# Altium project tracker-pro-airbnb-v1.1.PrjPcb (part 4 of 7)

## Sheet ESP32-Sheet.SchDoc
size 420 x 297 mm; SheetNumber: 7; SheetTotal: 10
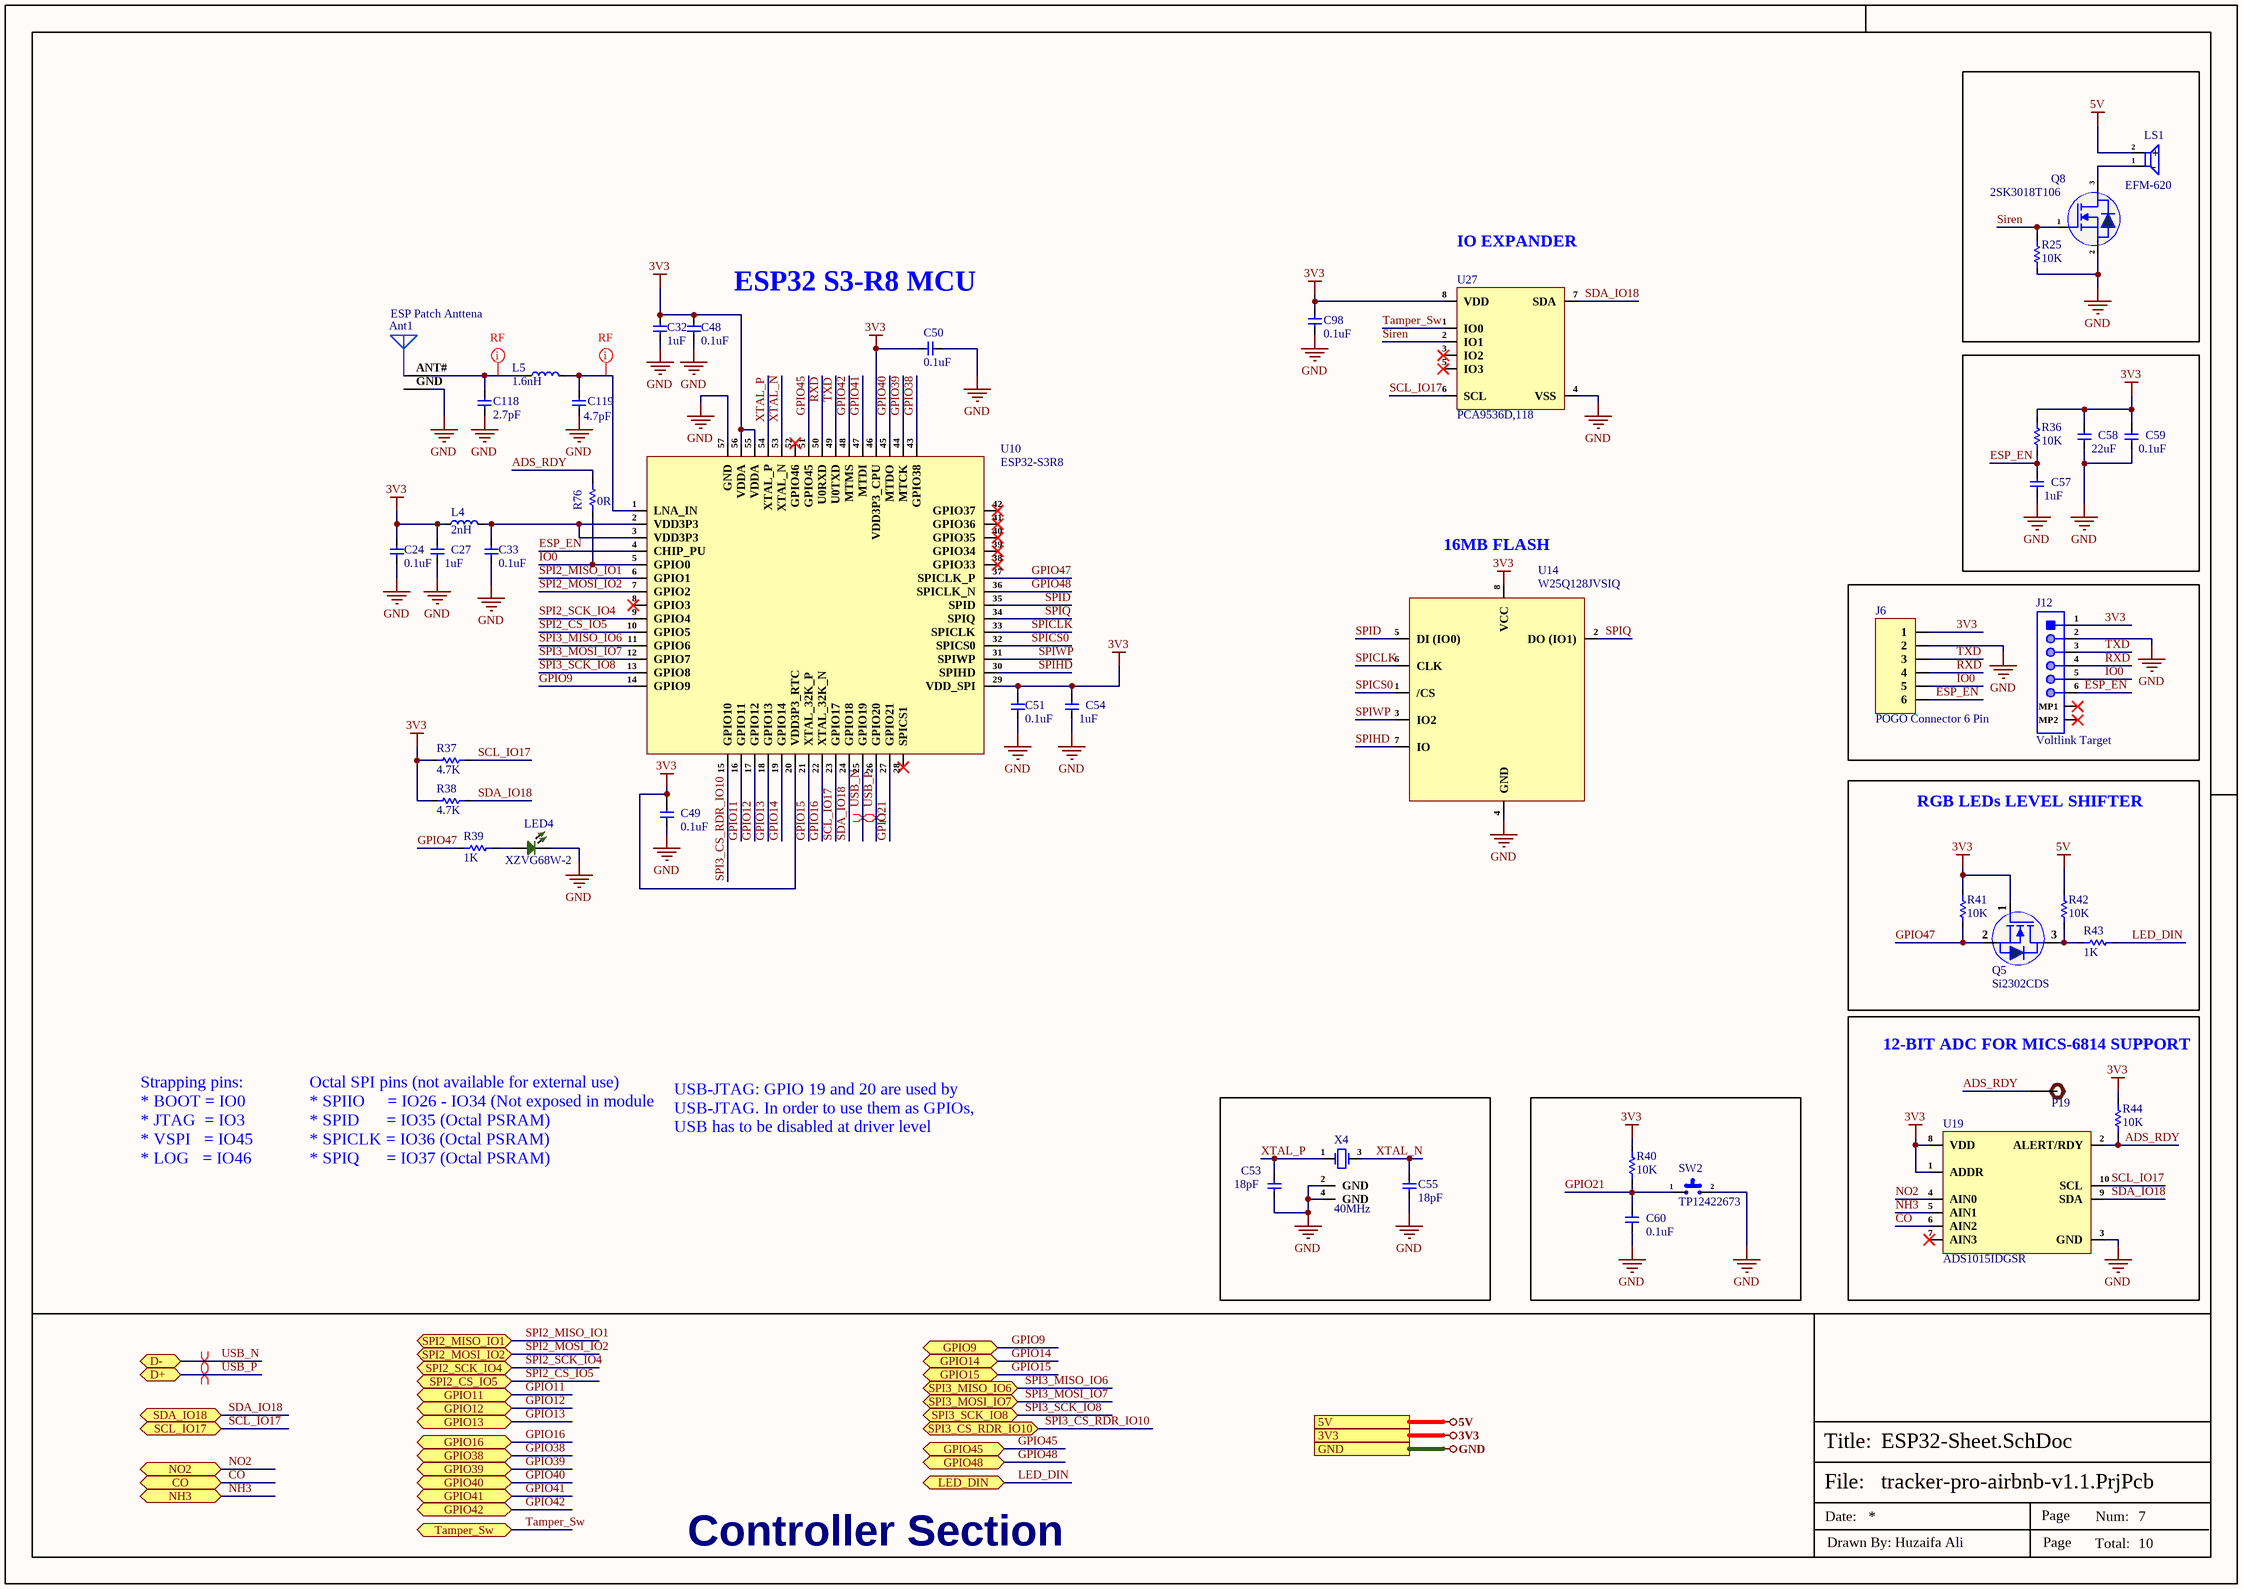
[diagram p5: ESP32-Sheet.SchDoc]

### Parts
Ant1  ESP Patch Anttena  [ESP Patch Antenna]  (net tie, no BOM)
C24  0.1uF  [Cap-0402]
C27  1uF  [Cap-0402]
C32  1uF  [Cap-0402]
C33  0.1uF  [Cap-0402]
C48  0.1uF  [Cap-0402]
C49  0.1uF  [Cap-0402]
C50  0.1uF  [Cap-0402]
C51  0.1uF  [Cap-0402]
C53  18pF  [Cap-0603]
C54  1uF  [Cap-0402]
C55  18pF  [Cap-0603]
C57  1uF  [Cap-0402]
C58  22uF  [Cap-0603]
C59  0.1uF  [Cap-0402]
C60  0.1uF  [Cap-0402]
C98  0.1uF  [Cap-0402]
C118  2.7pF  [CAP-0201]
C119  4.7pF  [CAP-0201]
J6  POGO Connector 6 Pin  [POGO 6 Pin]
J12  Voltlink Target  [Voltlink Target]
L4  2nH  [IND-0201]
L5  1.6nH  [IND-0201]
LED4  XZVG68W-2  [LED-0402]
LS1  EFM-620  [EFM-620]
P19  TEST POINT  [Test-point]  (value not drawn)
Q5  Si2302CDS  [Sot-23]
Q8  2SK3018T106  [SOT_323]
R25  10K  [Res-0402]
R36  10K  [Res-0402]
R37  4.7K  [Res-0603]
R38  4.7K  [Res-0603]
R39  1K  [Res-0603]
R40  10K  [Res-0603]
R41  10K  [Res-0402]
R42  10K  [Res-0402]
R43  1K  [Res-0603]
R44  10K  [Res-0402]
R76  0R  [Res-0603]
SW2  TP12422673  [TP12422673]
U10  ESP32-S3R8  [56-QFN (7x7)]
U14  W25Q128JVSIQ  [SOIC-8 (208 mil)]
U19  ADS1015IDGSR  [VSSOP-10]
U27  PCA9536D,118  [SOP-8]
X4  40MHz  [X322540MPB4SI_]

### Blocks framed on the sheet
RGB LEDs LEVEL SHIFTER: Q5 R41-R43
12-BIT ADC FOR MICS-6814 SUPPORT: P19 R44 U19

### Ports
3V3, 5V, CO (bidir), D+ (bidir), D- (bidir), GND, GPIO9 (bidir), GPIO11 (bidir), GPIO12 (bidir), GPIO13 (bidir), GPIO14 (bidir), GPIO15 (bidir), GPIO16 (bidir), GPIO38 (bidir), GPIO39 (bidir), GPIO40 (bidir), GPIO41 (bidir), GPIO42 (bidir), GPIO45 (bidir), GPIO48 (bidir), LED_DIN (bidir), NH3 (bidir), NO2 (bidir), SCL_IO17 (bidir), SDA_IO18 (bidir), SPI2_CS_IO5 (bidir), SPI2_MISO_IO1 (bidir), SPI2_MOSI_IO2 (bidir), SPI2_SCK_IO4 (bidir), SPI3_CS_RDR_IO10 (bidir), SPI3_MISO_IO6 (bidir), SPI3_MOSI_IO7 (bidir), SPI3_SCK_IO8 (bidir), Tamper_Sw (bidir)

### Nets
3V3: C24.2 C27.2 C32.2 C48.2 C49.2 C50.2 C51.2 C54.2 C58.2 C59.2 C98.1 J6.1 J12.1 L4.1 Q5.1(G) R36.2 R37.2 R38.2 R40.2 R41.1 R44.2 U10.20(VDD3P3_RTC) U10.29(VDD_SPI) U10.46(VDD3P3_CPU) U10.55(VDDA) U10.56(VDDA) U14.8(VCC) U19.1(ADDR) U19.8(VDD) U27.8(VDD) ; port 3V3
5V: LS1.2(+) R42.1 ; port 5V
GND: Ant1.GND C24.1 C27.1 C32.1 C33.1 C48.1 C49.1 C50.1 C51.1 C53.1 C54.1 C55.1 C57.1 C58.1 C59.1 C60.1 C98.2 C118.1 C119.1 J6.2 J12.2 LED4.2 Q8.2(S) R25.1 SW2.2 U10.57(GND) U14.4(GND) U19.3(GND) U27.4(VSS) X4.2(GND) X4.4(GND) ; port GND
ADS_RDY: P19.1 R44.1 R76.2 U19.2(ALERT/RDY)
CO: U19.6(AIN2) ; port CO
ESP_EN: C57.2 J6.6 J12.6 R36.1 U10.4(CHIP_PU)
GPIO9: U10.14(GPIO9) ; port GPIO9
GPIO11: U10.16(GPIO11) ; port GPIO11  [project net W5500_RST]
GPIO12: U10.17(GPIO12) ; port GPIO12
GPIO13: U10.18(GPIO13) ; port GPIO13
GPIO14: U10.19(GPIO14) ; port GPIO14  [project net B5]
GPIO15: U10.21(XTAL_32K_P) ; port GPIO15  [project net B6]
GPIO16: U10.22(XTAL_32K_N) ; port GPIO16
GPIO21: C60.2 R40.1 SW2.1 U10.27(GPIO21)
GPIO38: U10.43(GPIO38) ; port GPIO38
GPIO39: U10.44(MTCK) ; port GPIO39
GPIO40: U10.45(MTDO) ; port GPIO40
GPIO41: U10.47(MTDI) ; port GPIO41
GPIO42: U10.48(MTMS) ; port GPIO42
GPIO45: U10.51(GPIO45) ; port GPIO45  [project net CH2O_TX]
GPIO47: Q5.2(S) R39.1 R41.2 U10.37(SPICLK_P)
GPIO48: U10.36(SPICLK_N) ; port GPIO48  [project net CH2O_RX]
IO0: J6.5 J12.5 R76.1 U10.5(GPIO0)
LED_DIN: R43.2 ; port LED_DIN
NH3: U19.5(AIN1) ; port NH3
NO2: U19.4(AIN0) ; port NO2
RXD: J6.4 J12.4 U10.50(U0RXD)
SCL_IO17: R37.1 U10.23(GPIO17) U19.10(SCL) U27.6(SCL) ; port SCL_IO17  [project net SCL]
SDA_IO18: R38.1 U10.24(GPIO18) U19.9(SDA) U27.7(SDA) ; port SDA_IO18  [project net SDA]
Siren: Q8.1(G) R25.2 U27.2(IO1)
SPI2_CS_IO5: U10.10(GPIO5) ; port SPI2_CS_IO5
SPI2_MISO_IO1: U10.6(GPIO1) ; port SPI2_MISO_IO1
SPI2_MOSI_IO2: U10.7(GPIO2) ; port SPI2_MOSI_IO2
SPI2_SCK_IO4: U10.9(GPIO4) ; port SPI2_SCK_IO4
SPI3_CS_RDR_IO10: U10.15(GPIO10) ; port SPI3_CS_RDR_IO10  [project net B1]
SPI3_MISO_IO6: U10.11(GPIO6) ; port SPI3_MISO_IO6  [project net B4]
SPI3_MOSI_IO7: U10.12(GPIO7) ; port SPI3_MOSI_IO7  [project net B3]
SPI3_SCK_IO8: U10.13(GPIO8) ; port SPI3_SCK_IO8  [project net B2]
SPICLK: U10.33(SPICLK) U14.6(CLK)
SPICS0: U10.32(SPICS0) U14.1(/CS)
SPID: U10.35(SPID) U14.5(DI_(IO0))
SPIHD: U10.30(SPIHD) U14.7(IO)
SPIQ: U10.34(SPIQ) U14.2(DO_(IO1))
SPIWP: U10.31(SPIWP) U14.3(IO2)
Tamper_Sw: U27.1(IO0) ; port Tamper_Sw
TXD: J6.3 J12.3 U10.49(U0TXD)
USB_N: U10.25(GPIO19) ; port D-
USB_P: U10.26(GPIO20) ; port D+
XTAL_N: C55.2 U10.53(XTAL_N) X4.3(CRYSTAL)
XTAL_P: C53.2 U10.54(XTAL_P) X4.1(CRYSTAL)
NetAnt1_ANT#: Ant1.ANT# C118.2 L5.1
NetC33_2: C33.2 L4.2 U10.2(VDD3P3) U10.3(VDD3P3)
NetC119_2: C119.2 L5.2 U10.1(LNA_IN)
NetLED4_1: LED4.1 R39.2
NetLS1_1: LS1.1(-) Q8.3(D)
NetQ5_3: Q5.3(D) R42.2 R43.1

Not connected (* = marked no-connect by the designer): J12 MP1* MP2*; U10 8(GPIO3)* 28(SPICS1)* 38(GPIO33)* 39(GPIO34)* 40(GPIO35)* 41(GPIO36)* 42(GPIO37)* 52(GPIO46)*; U19 7(AIN3)*; U27 3(IO2)* 5(IO3)*

### Layout directives
differential pair; net class USB; differential pair class USB_Lines; rule Impedance Constraint [Min = 87.00    Max = 92.00    ]; rule Matched Net Lengths [Tolerance = 0.508mm]: USB_N, USB_P
net class RF: NetAnt1_ANT#, NetC119_2

### Notes on the sheet
- (near U27) IO EXPANDER
- ESP32 S3-R8 MCU
- (near U14) 16MB FLASH
- Strapping pins:
  * BOOT = IO0
  * JTAG  = IO3
  * VSPI   = IO45
  * LOG   = IO46
- Octal SPI pins (not available for external use)
  * SPIIO     = IO26 - IO34 (Not exposed in module
  * SPID      = IO35 (Octal PSRAM)
  * SPICLK = IO36 (Octal PSRAM)
  * SPIQ      = IO37 (Octal PSRAM)
- USB-JTAG: GPIO 19 and 20 are used by USB-JTAG. In order to use them as GPIOs, USB has to be disabled at driver level
- Controller Section
- File:
- Title:
- Date:
- Page
- Num:
- Total:
- Drawn By: Huzaifa Ali

### Library data of the parts
Ant1 = ESP Patch Anttena: ESP32 MIFA PCB ANTENNA; Item Type: Antenna; Manufacturer Part Number: ESP Patch Anttena
C24 C33 C48-C51 C59 C60 C98 = C1005X5R1H104K050BB: CAP CER 0.1UF 50V X5R 0402; Manufacturer: TDK; Dielectric Material: Ceramic; Capacitance: 100nF; Tolerance: 10%; Supplier 1: Digi-Key; Manufacturer Part Number: C1005X5R1H104K050BB; Stock 1: 1455182; Pricing 1: 1=0.12, 10=0.09, 50=0.049, 100=0.04, 500=0.02858, 1000=0.02245, 2500=0.02041, 5000=0.01878 (USD); Mount: Surface Mount; Case/Package: 0402; Case Code (Metric): 1005; Case Code (Imperial): 0402; Weight: 2.3E-05oz; Min Operating Temperature: -55°C; Max Operating Temperature: 85°C; Dielectric: X5R; Voltage Rating: 50V; Packaging: Tape and Reel; Voltage Rating (DC): 50V; Termination: SMD/SMT; Construction: Flat; Package Quantity: 1; Resistor Type: Ceramic; Voltage: 50V; Series: C; Length: 1mm; Width: 0.02inch; Height: 0.5mm; Depth: 0.5mm; Thickness: 0.022inch; Radiation Hardening: No; Lead Free: Lead Free; REACH SVHC: No SVHC; RoHS Compliant: Yes; ComponentLink1URL: https://product.tdk.com/info/en/catalog/spec/mlccspec_commercial_general_midvoltage_en.pdf?src-supplier=Digi-Key; ComponentLink1Description: https://product.tdk.com/info/en/catalog/spec/mlccspec_commercial_general_midvoltage_en.pdf?src-supplier=Digi-Key; ComponentLink2URL: http://www.tdk.co.jp/tefe02/e413_c.pdf?src-supplier=Future+Electronics; ComponentLink2Description: http://www.tdk.co.jp/tefe02/e413_c.pdf?src-supplier=Future+Electronics; ComponentLink3URL: https://www.verical.com/server-webapp/html/getDatasheet?partID=743571&src-supplier=Verical; ComponentLink3Description: https://www.verical.com/server-webapp/html/getDatasheet?partID=743571&src-supplier=Verical; ComponentLink4URL: http://www.tdk.co.jp/tefe02/e412_c.pdf?src-supplier=Avnet+Europe; ComponentLink4Description: http://www.tdk.co.jp/tefe02/e412_c.pdf?src-supplier=Avnet+Europe; Supplier Part Number 1: 445-5942-1-ND; LCSC Part Number: C2181865
C27 C32 C54 C57 = CC0402KRX5R6BB105: CAP CER 1UF 10V X5R 0402; Manufacturer: Yageo; Tolerance: 10%; Dissipation Factor: 15%; Supplier 1: Mouser; Manufacturer Part Number: CC0402KRX5R6BB105; RoHS: Yes; Category: Ceramic Capacitors; Stock 1: 6711367; Pricing 1: 1=0.11000, 10=0.05500, 50=0.05500, 100=0.03300, 500=0.02700, 1000=0.02200, 2500=0.02100, 10000=0.01800 (USD); Mount: Surface Mount; Case/Package: 0402; Number of Pins: 2; Case Code (Metric): 1005; Case Code (Imperial): 0402; Min Operating Temperature: -55°C; Max Operating Temperature: 85°C; Capacitance: 1uF; Dielectric: X5R; Package Quantity: 1; Voltage Rating: 10V; Packaging: Tape and Reel; Voltage Rating (DC): 10V; Termination: SMD/SMT; Resistor Type: Ceramic; Series: CC; Construction: Flat; Length: 1mm; Width: 0.02inch; Height: 0.5mm; Thickness: 0.022inch; Depth: 0.5mm; Radiation Hardening: No; REACH SVHC: No SVHC; Lead Free: Lead Free; Halogen Free: Halogen Free; RoHS Compliant: Yes; ComponentLink1URL: https://datasheet.ciiva.com/176/upy-gphc-x5r-4v-to-50v-12-176704.pdf?src-supplier=Digi-Key; ComponentLink1Description: https://datasheet.ciiva.com/176/upy-gphc-x5r-4v-to-50v-12-176704.pdf?src-supplier=Digi-Key; ComponentLink2URL: https://datasheet.ciiva.com/176/mlccorderingcode-176705.pdf?src-supplier=Digi-Key; ComponentLink2Description: https://datasheet.ciiva.com/176/mlccorderingcode-176705.pdf?src-supplier=Digi-Key; ComponentLink3URL: https://datasheet.ciiva.com/176/mlccorderingcode-176706.pdf?src-supplier=Digi-Key; ComponentLink3Description: https://datasheet.ciiva.com/176/mlccorderingcode-176706.pdf?src-supplier=Digi-Key; Supplier Part Number 1: 603-CC402KRX5R6BB105; LCSC Part Number: C106254
C53 C55 = CL10C180JB8NNNC: CAP CER 18PF 50V C0G/NP0 0603; Manufacturer: Samsung; Material: Ceramic; Tolerance: 5%; Dielectric: C0G; Temperature Coefficient: 300ppm/°C; Supplier 1: Arrow Electronics; Manufacturer Part Number: CL10C180JB8NNNC; RoHS: Yes; Category: Ceramic Capacitors; Stock 1: 1828000; Pricing 1: 4000=0.00360, 8000=0.00210 (USD); Mount: Surface Mount; Case/Package: 0603; Case Code (Metric): 1608; Case Code (Imperial): 0603; Contact Plating: Tin; Min Operating Temperature: -55°C; Max Operating Temperature: 125°C; Capacitance: 18pF; Voltage: 50V; Packaging: Tape and Reel; Voltage Rating: 50V; Series: CL; Construction: Flat; Length: 1.6mm; Width: 0.031inch; Height: 0.8mm; Depth: 0.8mm; Thickness: 0.035inch; Radiation Hardening: No; RoHS Compliant: Yes; ComponentLink1URL: https://datasheet.ciiva.com/25709/cl10c180jb8nnnc-25709670.pdf?src-supplier=Digi-Key; ComponentLink1Description: https://datasheet.ciiva.com/25709/cl10c180jb8nnnc-25709670.pdf?src-supplier=Digi-Key; ComponentLink2URL: https://datasheet.ciiva.com/26838/getdatasheetpartid-660083-26838496.pdf?src-supplier=Verical; ComponentLink2Description: https://datasheet.ciiva.com/26838/getdatasheetpartid-660083-26838496.pdf?src-supplier=Verical; ComponentLink3URL: https://datasheet.ciiva.com/29198/457219-da-01-en-vs-kondensator-0603-29198763.pdf?src-supplier=Conrad; ComponentLink3Description: https://datasheet.ciiva.com/29198/457219-da-01-en-vs-kondensator-0603-29198763.pdf?src-supplier=Conrad; ComponentLink4URL: https://datasheet.ciiva.com/26310/mlcc-catalogdownload2013-eng-26310310.pdf?src-supplier=Distrelec; ComponentLink4Description: https://datasheet.ciiva.com/26310/mlcc-catalogdownload2013-eng-26310310.pdf?src-supplier=Distrelec; Supplier Part Number 1: CL10C180JB8NNNC
C58 = CC0603MRX5R6BB226: CAP CER 22UF 10V X5R 0603; Manufacturer: Yageo; Tolerance: 20%; Item Type: Capacitor; Supplier 1: Digi-Key; Manufacturer Part Number: CC0603MRX5R6BB226; RoHS: Yes; Category: Ceramic Capacitors; Stock 1: 19628; Pricing 1: 1=0.68000, 10=0.48000, 50=0.36300, 100=0.31610, 500=0.23416, 1000=0.19903 (USD); Mount: Surface Mount; Case/Package: 0603; Case Code (Metric): 1608; Case Code (Imperial): 0603; Weight: 7.1E-05oz; Min Operating Temperature: -55°C; Max Operating Temperature: 85°C; Packaging: Tape and Reel; Capacitance: 22uF; Voltage Rating: 10V; Dielectric: X5R; Termination: SMD/SMT; Voltage Rating (DC): 10V; Package Quantity: 4000; Length: 0.063inch; Width: 0.8mm; Height: 0.8mm; Thickness: 0.035inch; Lead Free: Lead Free; Halogen Free: Halogen Free; RoHS Compliant: Yes; ComponentLink1URL: http://www.mouser.com/ds/2/447/Yageo_UPY-GP_NP0_16V-to-50V_9-358835.pdf?src-supplier=Mouser; ComponentLink1Description: http://www.mouser.com/ds/2/447/Yageo_UPY-GP_NP0_16V-to-50V_9-358835.pdf?src-supplier=Mouser; ComponentLink2URL: http://www.yageo.com/documents/recent/UPY-GPHC_X5R_4V-to-50V_25.pdf?src-supplier=Digi-Key; ComponentLink2Description: http://www.yageo.com/documents/recent/UPY-GPHC_X5R_4V-to-50V_25.pdf?src-supplier=Digi-Key; Supplier Part Number 1: 311-1819-1-ND; LCSC Part Number: C109447
C118 = CC0201CRNPO9BN2R7: CAP CER 2.7PF 50V C0G/NPO 0201; Manufacturer: Yageo; Dielectric: C0G; Item Type: Capacitor; Supplier: Avnet; Supplier Part Number: CC0201CRNPO9BN2R7; Manufacturer Part Number: CC0201CRNPO9BN2R7; RoHS: Yes; Category: Ceramic Capacitors; Stock: 15000; Pricing: 15000=0.0017 (USD); Mounting Technology: Surface Mount; Case/Package: 0201; Case Code (Imperial): 0201; Case Code (Metric): 0603; Weight: 6E-06oz; Min Operating Temperature: -55°C; Max Operating Temperature: 125°C; Value: 2.7pF; Packaging: Tape and Reel; Voltage Rating (DC): 50V; Voltage Rating: 50V; Termination: SMD/SMT; Series: CC; Length: 0.024inch; Width: 0.012inch; Thickness: 0.013inch; RoHS Compliant: Yes; ComponentLink1URL: https://datasheet.ciiva.com/13208/upy-gp-np0-16v-to-50v-8-13208314.pdf?src-supplier=Mouser; ComponentLink1Description: https://datasheet.ciiva.com/13208/upy-gp-np0-16v-to-50v-8-13208314.pdf?src-supplier=Mouser; LCSC Part Number: C325439
C119 = CC0201BRNPO9BN4R7: CAP CER 4.7PF 50V C0G/NPO 0201; Manufacturer: Yageo; Item Type: Capacitor; Supplier: Arrow Electronics; Supplier Part Number: CC0201BRNPO9BN4R7; Manufacturer Part Number: CC0201BRNPO9BN4R7; RoHS: Yes; Category: Ceramic Capacitors; Stock: 210000; Pricing: 15000=0.0023 (USD); Mounting Technology: Surface Mount; Case/Package: 0201; Min Operating Temperature: -55°C; Max Operating Temperature: 125°C; Packaging: Tape and Reel; Value: 4.7pF; Voltage Rating: 50V; Series: CC; Length: 0.024inch; Width: 0.012inch; Thickness: 0.013inch; RoHS Compliant: Yes; ComponentLink1URL: https://www.yageo.com/upload/media/product/productsearch/datasheet/mlcc/UPY-GP_NP0_16V-to-50V_18.pdf?src-supplier=Digi-Key; ComponentLink1Description: https://www.yageo.com/upload/media/product/productsearch/datasheet/mlcc/UPY-GP_NP0_16V-to-50V_18.pdf?src-supplier=Digi-Key; ComponentLink2URL: http://www.yageo.com/documents/recent/UPY-GP_NP0_16V-to-50V_16.pdf?src-supplier=Digi-Key; ComponentLink2Description: http://www.yageo.com/documents/recent/UPY-GP_NP0_16V-to-50V_16.pdf?src-supplier=Digi-Key; LCSC Part Number: C505471
J6 = POGO Connector 6 Pin: Pogo Pad 2.5mm 6 Pin
J12 = C145963: 1x6P SH 1 1mm 6 SMD,P=1mm Wire To Board / Wire To Wire Connector ROHS; Manufacturer: BOOMELE; Manufacturer Part Number: C145963; Package: SMD,P=1mm; LCSC Part Number: C145963; Item Type: Connector; ComponentLink1Description: LCSC; ComponentLink1URL: https://www.lcsc.com/product-detail/Wire-To-Board-Wire-To-Wire-Connector_BOOMELE-Boom-Precision-Elec-C145963_C145963.html
L4 = MLG0603P2N0CT000: FIXED IND 2NH 600MA 100 MOHM SMD; Manufacturer: TDK; Core Material: Non-Magnetic; Shielding: Unshielded; DC Resistance (DCR): 100mR; Self Resonant Frequency: 8.5GHz; Test Frequency: 500MHz; Item Type: Inductor; Supplier: Digi-Key; Supplier Part Number: 445-172431-1-ND; Manufacturer Part Number: MLG0603P2N0CT000; RoHS: Yes; Category: Fixed Inductors; Stock: 23499; Pricing: 1=0.13, 10=0.118, 25=0.1, 50=0.0882, 100=0.0808, 250=0.07352, 500=0.06908, 1000=0.05292, 2500=0.04998 (USD); Mounting Technology: Surface Mount; Case/Package: 0201; Case Code (Metric): 0603; Case Code (Imperial): 0201; Min Operating Temperature: -55°C; Max Operating Temperature: 125°C; Package Quantity: 15000; Packaging: Cut Tape; Current Rating: 600mA; Value: 2nH; Series: MLG-P; Length: 0.024inch; Width: 0.012inch; Height - Seated (Max): 0.013inch; RoHS Compliant: Yes; ComponentLink1URL: https://datasheet.ciiva.com/41860/inductor-commercial-high-frequency-mlg-qp-en-41860968.pdf?src-supplier=Digi-Key; ComponentLink1Description: https://datasheet.ciiva.com/41860/inductor-commercial-high-frequency-mlg-qp-en-41860968.pdf?src-supplier=Digi-Key; LCSC Part Number: C531323
L5 = LQP03HQ1N6B02D: FIXED IND 1.6NH 1A 50 MOHM SMD; Manufacturer: Murata; Core Material: Non-Magnetic; Shielding: Unshielded; DC Resistance (DCR): 50mR; Self Resonant Frequency: 10GHz; Test Frequency: 500MHz; Item Type: Inductor; Supplier: Digi-Key; Supplier Part Number: 490-13883-1-ND; Manufacturer Part Number: LQP03HQ1N6B02D; RoHS: Yes; Category: Fixed Inductors; Stock: 27606; Pricing: 1=0.16, 10=0.145, 25=0.1236, 50=0.109, 100=0.1, 250=0.09088, 500=0.08544, 1000=0.06545, 2500=0.06181 (USD); Mounting Technology: Surface Mount; Case/Package: 0201; Case Code (Imperial): 0201; Case Code (Metric): 0603; Min Operating Temperature: -55°C; Max Operating Temperature: 125°C; Packaging: Cut Tape; Value: 1.6nH; Current Rating: 1A; Series: LQP03; RoHS Compliant: Yes; ComponentLink1URL: http://search.murata.co.jp/Ceramy/image/img/P02/JELF243C-0021.pdf?src-supplier=Digi-Key; ComponentLink1Description: http://search.murata.co.jp/Ceramy/image/img/P02/JELF243C-0021.pdf?src-supplier=Digi-Key; LCSC Part Number: C237384
LED4 = XZVG68W-2: LED GREEN CLEAR CHIP SMD; Manufacturer: SunLED; Lens Color: Colorless; Luminous Intensity: 49mcd; Test Current: 20mA; Viewing Angle: 120°; Dominant Wavelength: 570nm; Forward Voltage: 2.1V; Supplier 1: Digi-Key; Manufacturer Part Number: XZVG68W-2; Stock 1: 4185; Pricing 1: 1=0.5, 10=0.36, 100=0.16, 500=0.112, 1000=0.092 (USD); Mount: Surface Mount; Case/Package: 0402; Color: Green; Case Code (Metric): 1005; Case Code (Imperial): 0402; Packaging: Tape and Reel; Lens Transparency: Clear; Length: 1mm; Height: 0.6mm; Width: 0.5mm; ComponentLink1URL: http://www.sunledusa.com/products/spec/XZVG68W-2.pdf?src-supplier=Digi-Key; ComponentLink1Description: http://www.sunledusa.com/products/spec/XZVG68W-2.pdf?src-supplier=Digi-Key; ComponentLink2URL: https://www.sunledusa.com/products/spec/XZVG68W-2.pdf?src-supplier=Digi-Key; ComponentLink2Description: https://www.sunledusa.com/products/spec/XZVG68W-2.pdf?src-supplier=Digi-Key; Supplier Part Number 1: 1497-1219-6-ND; Item Type: LED
LS1 = EFM-620: BUZZER 9V 40MM TH; Manufacturer: East Electronics; Pakage: Custom; Manufacturer Part Number: EFM-620; Item Type: Buzzer; ComponentLink1Description: Digikey; ComponentLink1URL: https://www.digikey.com/en/products/detail/east-electronics/EFM-620/13170549
P19 = TEST POINT: Test Point ON; Item Type: TEST POINT
Q5 = Si2302CDS: N-CHANNEL 20-V (D-S) MOSFET; Manufacturer: TECH PUBLIC; ComponentLink1Description: LCSC; ComponentLink1URL: https://www.lcsc.com/product-detail/MOSFETs_TECH-PUBLIC-SI2302CDS_C5310968.html; Manufacturer Part Number: SI2302CDS; Package: SOT-23; LCSC Part Number: C5310968; Item Type: Mosfet
Q8 = 2SK3018T106: MOSFET N-CH 30V .1A SOT-323; Manufacturer: Rohm; Rise Time: 35ns; Nominal Vgs: 1.5V; Rds On Max: 8R; Input Capacitance: 13pF; Continuous Drain Current (ID): 100mA; Power Dissipation: 200mW; Drain to Source Resistance: 7R; Turn-Off Delay Time: 80ns; Turn-On Delay Time: 15ns; Element Configuration: Single; Gate to Source Voltage (Vgs): 20V; On-State Resistance: 13R; Polarity: N-CHANNEL; Supplier 1: Digi-Key; Manufacturer Part Number: 2SK3018T106; RoHS: Yes; Category: MOSFETs; Stock 1: 35632; Pricing 1: 1=0.40000, 10=0.33100, 100=0.17560, 500=0.11550, 1000=0.07854 (USD); Mount: Surface Mount; Case/Package: SOT-323; Number of Pins: 3; Contact Plating: Copper,Tin,Silver; Min Operating Temperature: -55°C; Max Operating Temperature: 150°C; Package Quantity: 3000; Packaging: Tape and Reel; Dual Supply Voltage: 30V; Drain to Source Breakdown Voltage: 30V; Fall Time: 35ns; Drain to Source Voltage (Vdss): 30V; Max Power Dissipation: 200mW; Threshold Voltage: 1.5V; Termination: SMD/SMT; Voltage Rating (DC): 30V; Current Rating: 100mA; Drain-source On Resistance-Max: 13R; Series: -; Length: 2mm; Width: 1.25mm; Height: 0.8mm; Radiation Hardening: No; Reach SVHC Compliant: Yes; Lead Free: Lead Free; RoHS Compliant: Yes; ComponentLink1URL: https://datasheet.ciiva.com/16307/2sk3018-16307708.pdf?src-supplier=Future+Electronics; ComponentLink1Description: https://datasheet.ciiva.com/16307/2sk3018-16307708.pdf?src-supplier=Future+Electronics; ComponentLink2URL: https://datasheet.ciiva.com/13043/2sk3018-209190-13043441.pdf?src-supplier=Mouser; ComponentLink2Description: https://datasheet.ciiva.com/13043/2sk3018-209190-13043441.pdf?src-supplier=Mouser; ComponentLink3URL: https://datasheet.ciiva.com/1188/2sk3018-1188589.pdf?src-supplier=Element14; ComponentLink3Description: https://datasheet.ciiva.com/1188/2sk3018-1188589.pdf?src-supplier=Element14; ComponentLink4URL: https://datasheet.ciiva.com/934/2sk3018-934635.pdf?src-supplier=Digi-Key; ComponentLink4Description: https://datasheet.ciiva.com/934/2sk3018-934635.pdf?src-supplier=Digi-Key; ComponentLink5URL: https://datasheet.ciiva.com/934/2sk3018-934636.pdf?src-supplier=Digi-Key; ComponentLink5Description: https://datasheet.ciiva.com/934/2sk3018-934636.pdf?src-supplier=Digi-Key; LCSC Part Number: C113315; Item Type: Mosfet; Supplier Part Number 1: 2SK3018T106CT-ND
R25 R36 R41 R42 R44 = RC0402FR-0710KL: RES 10K OHM 1% 1/16W 0402; Manufacturer: Yageo; Resistance: 10kR; Voltage Rating (DC): 50V; Temperature Coefficient: 100ppm/°C; Power Rating: 62.5mW; Max Power Dissipation: 63mW; Item Type: Resistor; Supplier 1: Mouser; Manufacturer Part Number: RC0402FR-0710KL; RoHS: Yes; Category: Chip SMD Resistors; Stock 1: 18648329; Pricing 1: 1=0.10000, 10=0.01400, 50=0.01400, 100=0.00500, 1000=0.00300, 10000=0.00200 (USD); Case/Package: 0402; Number of Pins: 2; Case Code (Imperial): 0402; Case Code (Metric): 1005; Min Operating Temperature: -55°C; Max Operating Temperature: 155°C; Resistor Type: Thick Film; Tolerance: 1%; Packaging: Tape and Reel; Voltage Rating: 50V; Termination: SMD/SMT; Working Voltage: 50V; Number of Terminations: 2; Features: Moisture Resistant; Series: RC; Resistance Tolerance: 1%; Construction: Rectangular; Length: 1mm; Width: 0.5mm; Height: 0.32mm; Depth: 0.5mm; Lead Pitch: 0.2mm; REACH SVHC: No SVHC; Lead Free: Lead Free; RoHS Compliant: Yes; Military Standard: Not; ComponentLink1URL: https://datasheet.ciiva.com/7660/38568-7660787.pdf?src-supplier=Element14; ComponentLink1Description: https://datasheet.ciiva.com/7660/38568-7660787.pdf?src-supplier=Element14; ComponentLink2URL: https://datasheet.ciiva.com/7849/1686128-7849814.pdf?src-supplier=Element14; ComponentLink2Description: https://datasheet.ciiva.com/7849/1686128-7849814.pdf?src-supplier=Element14; ComponentLink3URL: https://datasheet.ciiva.com/7983/1018594-7983486.pdf?src-supplier=Element14; ComponentLink3Description: https://datasheet.ciiva.com/7983/1018594-7983486.pdf?src-supplier=Element14; ComponentLink4URL: https://datasheet.ciiva.com/22747/1018594-22747512.pdf?src-supplier=Element14; ComponentLink4Description: https://datasheet.ciiva.com/22747/1018594-22747512.pdf?src-supplier=Element14; ComponentLink5URL: https://datasheet.ciiva.com/12667/pyu-rc0402-51-rohs-l-6-r-12667067.pdf?src-supplier=Mouser; ComponentLink5Description: https://datasheet.ciiva.com/12667/pyu-rc0402-51-rohs-l-6-r-12667067.pdf?src-supplier=Mouser; ComponentLink6URL: https://datasheet.ciiva.com/7849/1784430-7849813.pdf?src-supplier=Element14; ComponentLink6Description: https://datasheet.ciiva.com/7849/1784430-7849813.pdf?src-supplier=Element14; ComponentLink7URL: https://datasheet.ciiva.com/7849/1784430-7849815.pdf?src-supplier=Element14; ComponentLink7Description: https://datasheet.ciiva.com/7849/1784430-7849815.pdf?src-supplier=Element14; Supplier Part Number 1: 603-RC0402FR-0710KL; LCSC Part Number: C60490
R37 R38 = RC0603FR-074K7L: RES SMD 4.7K OHM 1% 1/10W 0603; Manufacturer: Yageo; Item Type: Resistor; Manufacturer Part Number: RC0603FR-074K7L; Package: 0603; ComponentLink7Description: LCSC; ComponentLink7URL: https://www.lcsc.com/product-detail/Chip-Resistor-Surface-Mount_YAGEO-RC0603FR-074K7L_C99782.html; LCSC Part Number: C99782
R39 R43 = RC0603FR-071KL: RES SMD 1K OHM 1% 1/10W 0603; Manufacturer: Yageo; Resistance: 1kR; Temperature Coefficient: 100ppm/°C; Power Rating: 100mW; Voltage Rating: 50V; Item type: Resistor; ComponentLink1URL: https://www.verical.com/server-webapp/html/getDatasheet?partID=409289&src-supplier=Verical; ComponentLink1Description: https://www.verical.com/server-webapp/html/getDatasheet?partID=409289&src-supplier=Verical; Supplier 1: Digi-Key; Manufacturer Part Number: RC0603FR-071KL; Stock 1: 21472395; Pricing 1: 1=0.1, 10=0.023, 100=0.0094, 1000=0.0042, 2500=0.0037 (USD); Case/Package: 0603; Contact Plating: Tin,Matte; Case Code (Imperial): 0603; Case Code (Metric): 1608; Min Operating Temperature: -55°C; Max Operating Temperature: 155°C; Tolerance: 1%; Composition: Thick Film; Packaging: Tape and Reel; Termination: SMD/SMT; Military Standard: Not; Length: 1.6mm; Height: 0.45mm; Depth: 0.8mm; Radiation Hardening: No; REACH SVHC: No SVHC; Lead Free: Lead Free; ComponentLink2URL: http://documents.rs-components.com/techlib://itc_doclist_GB.htm?stockno=5048928&src-supplier=RSComponents; ComponentLink2Description: http://documents.rs-components.com/techlib://itc_doclist_GB.htm?stockno=5048928&src-supplier=RSComponents; ComponentLink3URL: http://www.yageo.com/documents/recent/PYu-RC0603_51_RoHS_L_4.pdf?src-supplier=Avnet+Europe; ComponentLink3Description: http://www.yageo.com/documents/recent/PYu-RC0603_51_RoHS_L_4.pdf?src-supplier=Avnet+Europe; ComponentLink4URL: http://www.farnell.com/datasheets/2167052.pdf?src-supplier=Element14; ComponentLink4Description: http://www.farnell.com/datasheets/2167052.pdf?src-supplier=Element14; ComponentLink5URL: http://www.farnell.com/datasheets/1868787.pdf?src-supplier=Element14; ComponentLink5Description: http://www.farnell.com/datasheets/1868787.pdf?src-supplier=Element14; ComponentLink6URL: http://www.yageo.com/documents/recent/PYu-RC_Group_51_RoHS_L_2.pdf?src-supplier=Avnet; ComponentLink6Description: http://www.yageo.com/documents/recent/PYu-RC_Group_51_RoHS_L_2.pdf?src-supplier=Avnet; ComponentLink7URL: https://www.verical.com/server-webapp/html/getDatasheet?partID=404327&src-supplier=Verical; ComponentLink7Description: https://www.verical.com/server-webapp/html/getDatasheet?partID=404327&src-supplier=Verical; ComponentLink8URL: http://www.farnell.com/datasheets/443971.pdf?src-supplier=Element14; ComponentLink8Description: http://www.farnell.com/datasheets/443971.pdf?src-supplier=Element14; Supplier Part Number 1: 311-1.00KHRDKR-ND; LCSC Part Number: C22548
R40 = RC0603FR-0710KL: RES SMD 10K Ohm 1% 1/10W 0603; Manufacturer: Yageo; Resistance: 10kR; Temperature Coefficient: 100ppm/°C; Voltage Rating (DC): 50V; Power Rating: 100mW; Voltage Rating: 75V; Item Type: Resistor; Supplier 1: Digi-Key; Manufacturer Part Number: RC0603FR-0710KL; RoHS: Yes; Category: Chip SMD Resistors; Stock 1: 25249139; Pricing 1: 1=0.10000, 10=0.02400, 100=0.00970, 1000=0.00436, 2500=0.00378 (USD); Case/Package: 0603; Number of Pins: 2; Case Code (Imperial): 0603; Case Code (Metric): 1608; Weight: 7.1E-05oz; Size Code: 0603; Min Operating Temperature: -55°C; Max Operating Temperature: 155°C; Tolerance: 1%; Resistor Type: Thick Film; Packaging: Tape and Reel; Termination: SMD/SMT; Features: Moisture Resistant; Series: RC; Max Power Dissipation: 100mW; Number of Terminations: 2; Resistance Tolerance: 1%; Construction: Rectangular; Length: 1.6mm; Width: 0.8mm; Height: 0.45mm; Depth: 0.8mm; Lead Pitch: 0.3mm; REACH SVHC: Unknown; Lead Free: Lead Free; Military Standard: Not; RoHS Compliant: Yes; ComponentLink1URL: https://datasheet.ciiva.com/7660/38590-7660789.pdf?src-supplier=Element14; ComponentLink1Description: https://datasheet.ciiva.com/7660/38590-7660789.pdf?src-supplier=Element14; ComponentLink2URL: https://datasheet.ciiva.com/7983/443971-7983596.pdf?src-supplier=Element14; ComponentLink2Description: https://datasheet.ciiva.com/7983/443971-7983596.pdf?src-supplier=Element14; ComponentLink3URL: https://datasheet.ciiva.com/22747/443971-22747519.pdf?src-supplier=Element14; ComponentLink3Description: https://datasheet.ciiva.com/22747/443971-22747519.pdf?src-supplier=Element14; ComponentLink4URL: https://datasheet.ciiva.com/46440/1868787-46440891.pdf?src-supplier=Element14; ComponentLink4Description: https://datasheet.ciiva.com/46440/1868787-46440891.pdf?src-supplier=Element14; ComponentLink5URL: https://datasheet.ciiva.com/7746/1738695-7746239.pdf?src-supplier=Element14; ComponentLink5Description: https://datasheet.ciiva.com/7746/1738695-7746239.pdf?src-supplier=Element14; ComponentLink6URL: https://datasheet.ciiva.com/15189/getdatasheetpartid-409289-15189591.pdf?src-supplier=Verical; ComponentLink6Description: https://datasheet.ciiva.com/15189/getdatasheetpartid-409289-15189591.pdf?src-supplier=Verical; Supplier Part Number 1: 311-10.0KHRCT-ND; LCSC Part Number: C98220
R76 = RC0603FR-070RL: RES SMD 0R, 1%, 0.1W, 0603; Manufacturer: Yageo; Item Type: Resistor; Manufacturer Part Number: RC0603FR-070RL; Package: 0603; LCSC Part Number: C100044; ComponentLink9Description: LCSC; ComponentLink9URL: https://www.lcsc.com/product-detail/Chip-Resistor-Surface-Mount_YAGEO-RC0603FR-070RL_C100044.html
SW2 = TP12422673: 50mA 100MΩ 100000 Times 260gf@±50gf 12V Surface Mount SPST SMD Tactile Switches ROHS; Manufacturer: ROCPU Switch; Manufacturer Part Number: TP12422673; Package: SMD; LCSC Part Number: C5381384; Item Type: Tactile Switch; ComponentLink1Description: LCSC; ComponentLink1URL: https://www.lcsc.com/product-detail/Tactile-Switches_ROCPU-Switches-TP12422673_C5381384.html
U10 = ESP32-S3R8: SMD IC ESP32-S3R8, DUAL-CORE MCU; Manufacturer: Espressif Systems; Supplier 1: Mouser; Manufacturer Part Number: ESP32-S3R8; RoHS: No; Category: RF Receivers, Transceivers; Stock 1: 2366; Pricing 1: 1=2.46, 10=2.46, 50=2.46, 100=2.46, 1000=2.46, 10000=2.46 (USD); Supplier Part Number 1: 356-ESP32-S3R8; Item Type: IC
U14 = W25Q128JVSIQ: IC FLASH 128MBIT SPI/QUAD 8SOIC; Manufacturer: Winbond; Memory Format: Non-Volatile,FLASH; Frequency: 133MHz; Memory Size: 128Mb; Supplier: Arrow Electronics; Supplier Part Number: W25Q128JVSIQ; Manufacturer Part Number: W25Q128JVSIQ; RoHS: Yes; Category: Flash; Stock: 3659; Pricing: 1=1.6411, 10=1.4568, 25=1.4422, 50=1.3009, 100=1.2498, 250=1.2373, 500=1.1781, 1000=1.1392, 5000=1.0957 (USD); Mounting Technology: Surface Mount; Case/Package: SOIC; Min Operating Temperature: -40°C; Max Operating Temperature: 85°C; Packaging: Tray; Series: SpiFlash®; RoHS Compliant: Yes; ComponentLink1URL: http://www.winbond.com/resource-files/w25q128jv%20revf%2003272018%20plus.pdf?src-supplier=Digikey; ComponentLink1Description: http://www.winbond.com/resource-files/w25q128jv%20revf%2003272018%20plus.pdf?src-supplier=Digikey; LCSC Part Number: C97521; Item Type: IC
U19 = ADS1015IDGSR: IC ADC 12BIT SIGMA-DELTA 10VSSOP; Manufacturer: Texas Instruments; Operating Supply Voltage: 3.3V; Min Supply Voltage: 2V; Max Supply Voltage: 5.5V; Interface: I2C; Number of Converters: 1; Resolution: 12b; Number of Bits: 12; Sampling Rate: 3.3KS/s; Polarity: Bipolar; Integral Nonlinearity (INL): 0.5LSB; Supply Type: Single; Number of Inputs: 4; Power Dissipation: 900uW; Supplier 1: Digi-Key; Manufacturer Part Number: ADS1015IDGSR; RoHS: Yes; Category: Analog to Digital Converters (ADCs); Pricing 1: 1=3.09000, 10=2.77500, 25=2.62360, 100=2.27370, 250=2.15712, 500=1.93556, 1000=1.65000 (USD); Case/Package: VSSOP; Number of Pins: 10; Contact Plating: Gold; Min Operating Temperature: -40°C; Max Operating Temperature: 125°C; Packaging: Tape and Reel; Package Quantity: 2500; Number of A/D Converters: 1; Number of Elements: 1; Conversion Rate: 3.3KS/s; Max Supply Voltage (DC): 5.5V; Min Supply Voltage (DC): 2V; Series: -; Radiation Hardening: No; Reach SVHC Compliant: Yes; Lead Free: Lead Free; RoHS Compliant: Yes; ComponentLink1URL: https://datasheet.ciiva.com/14260/sbas473c-14260076.pdf?src-supplier=Avnet; ComponentLink1Description: https://datasheet.ciiva.com/14260/sbas473c-14260076.pdf?src-supplier=Avnet; ComponentLink2URL: https://datasheet.ciiva.com/6662/ads1013-6662716.pdf?src-supplier=Digi-Key; ComponentLink2Description: https://datasheet.ciiva.com/6662/ads1013-6662716.pdf?src-supplier=Digi-Key; Supplier Part Number 1: 296-41185-1-ND; LCSC Part Number: C193969; Item Type: IC
U27 = PCA9536D,118: 400kHz SO-8 I/O Expanders ROHS; Manufacturer: NXP Semiconductors; Number of I/Os: 4; Interface: I2C,SMBus,Serial; Output Current: 50mA; Operating Supply Voltage: 5.5V; Operating Supply Current: 85mA; Max Power Dissipation: 200mW; Item Type: IC; Supplier: Avnet; Supplier Part Number: PCA9536D,118; Manufacturer Part Number: PCA9536D,118; RoHS: Yes; Category: Interface ICs; Stock: 96987; Pricing: 494=0.72487, 500=0.70966, 990=0.68938, 2500=0.67925, 5000=0.66404, 25000=0.64883, 50000=0.62856 (USD); Mounting Technology: Surface Mount; Case/Package: SO; Pins: 8; Weight: 0.01787oz; Min Operating Temperature: -40°C; Max Operating Temperature: 85°C; Packaging: Tape and Reel; Package Quantity: 1; Clock Frequency: 400kHz; Frequency: 400kHz; Series: -; Nominal Supply Voltage: 5.5V; Supply Current: 85mA; Lead Free: Lead Free; RoHS Compliant: Yes; ComponentLink1URL: https://datasheet.ciiva.com/8125/pca9536-8125671.pdf?src-supplier=Avnet; ComponentLink1Description: https://datasheet.ciiva.com/8125/pca9536-8125671.pdf?src-supplier=Avnet; ComponentLink2URL: https://datasheet.ciiva.com/1779/pca9536-1779979.pdf?src-supplier=Digi-Key; ComponentLink2Description: https://datasheet.ciiva.com/1779/pca9536-1779979.pdf?src-supplier=Digi-Key; ComponentLink3URL: https://datasheet.ciiva.com/1779/pca9536-1779980.pdf?src-supplier=Digi-Key; ComponentLink3Description: https://datasheet.ciiva.com/1779/pca9536-1779980.pdf?src-supplier=Digi-Key; ComponentLink4URL: https://datasheet.ciiva.com/1779/pca9536-1779981.pdf?src-supplier=Digi-Key; ComponentLink4Description: https://datasheet.ciiva.com/1779/pca9536-1779981.pdf?src-supplier=Digi-Key; ComponentLink5URL: https://datasheet.ciiva.com/3148/pca9536-3148502.pdf?src-supplier=Avnet; ComponentLink5Description: https://datasheet.ciiva.com/3148/pca9536-3148502.pdf?src-supplier=Avnet; ComponentLink6URL: https://datasheet.ciiva.com/3149/pca9536-3149304.pdf?src-supplier=Avnet; ComponentLink6Description: https://datasheet.ciiva.com/3149/pca9536-3149304.pdf?src-supplier=Avnet; ComponentLink7URL: https://datasheet.ciiva.com/16291/pca9536-16291035.pdf?src-supplier=Future+Electronics; ComponentLink7Description: https://datasheet.ciiva.com/16291/pca9536-16291035.pdf?src-supplier=Future+Electronics; LCSC Part Number: C2688883
X4 = X322540MPB4SI: 40MHz SMD Crystal Resonator 15pF SMD3225-4P Crystals ROHS; Manufacturer: Yangxing Tech; Manufacturer Part Number: X322540MPB4SI; Value: 40MHZ; LCSC Part Number: C9010; ComponentLink1Description: LCSC; ComponentLink1URL: https://www.lcsc.com/product-detail/Crystals_Yangxing-Tech-X322540MPB4SI_C9010.html; Item Type: Crystal

## Sheet Ethernet-PoE-Sheet.SchDoc
size 420 x 297 mm; SheetNumber: 8; SheetTotal: 10
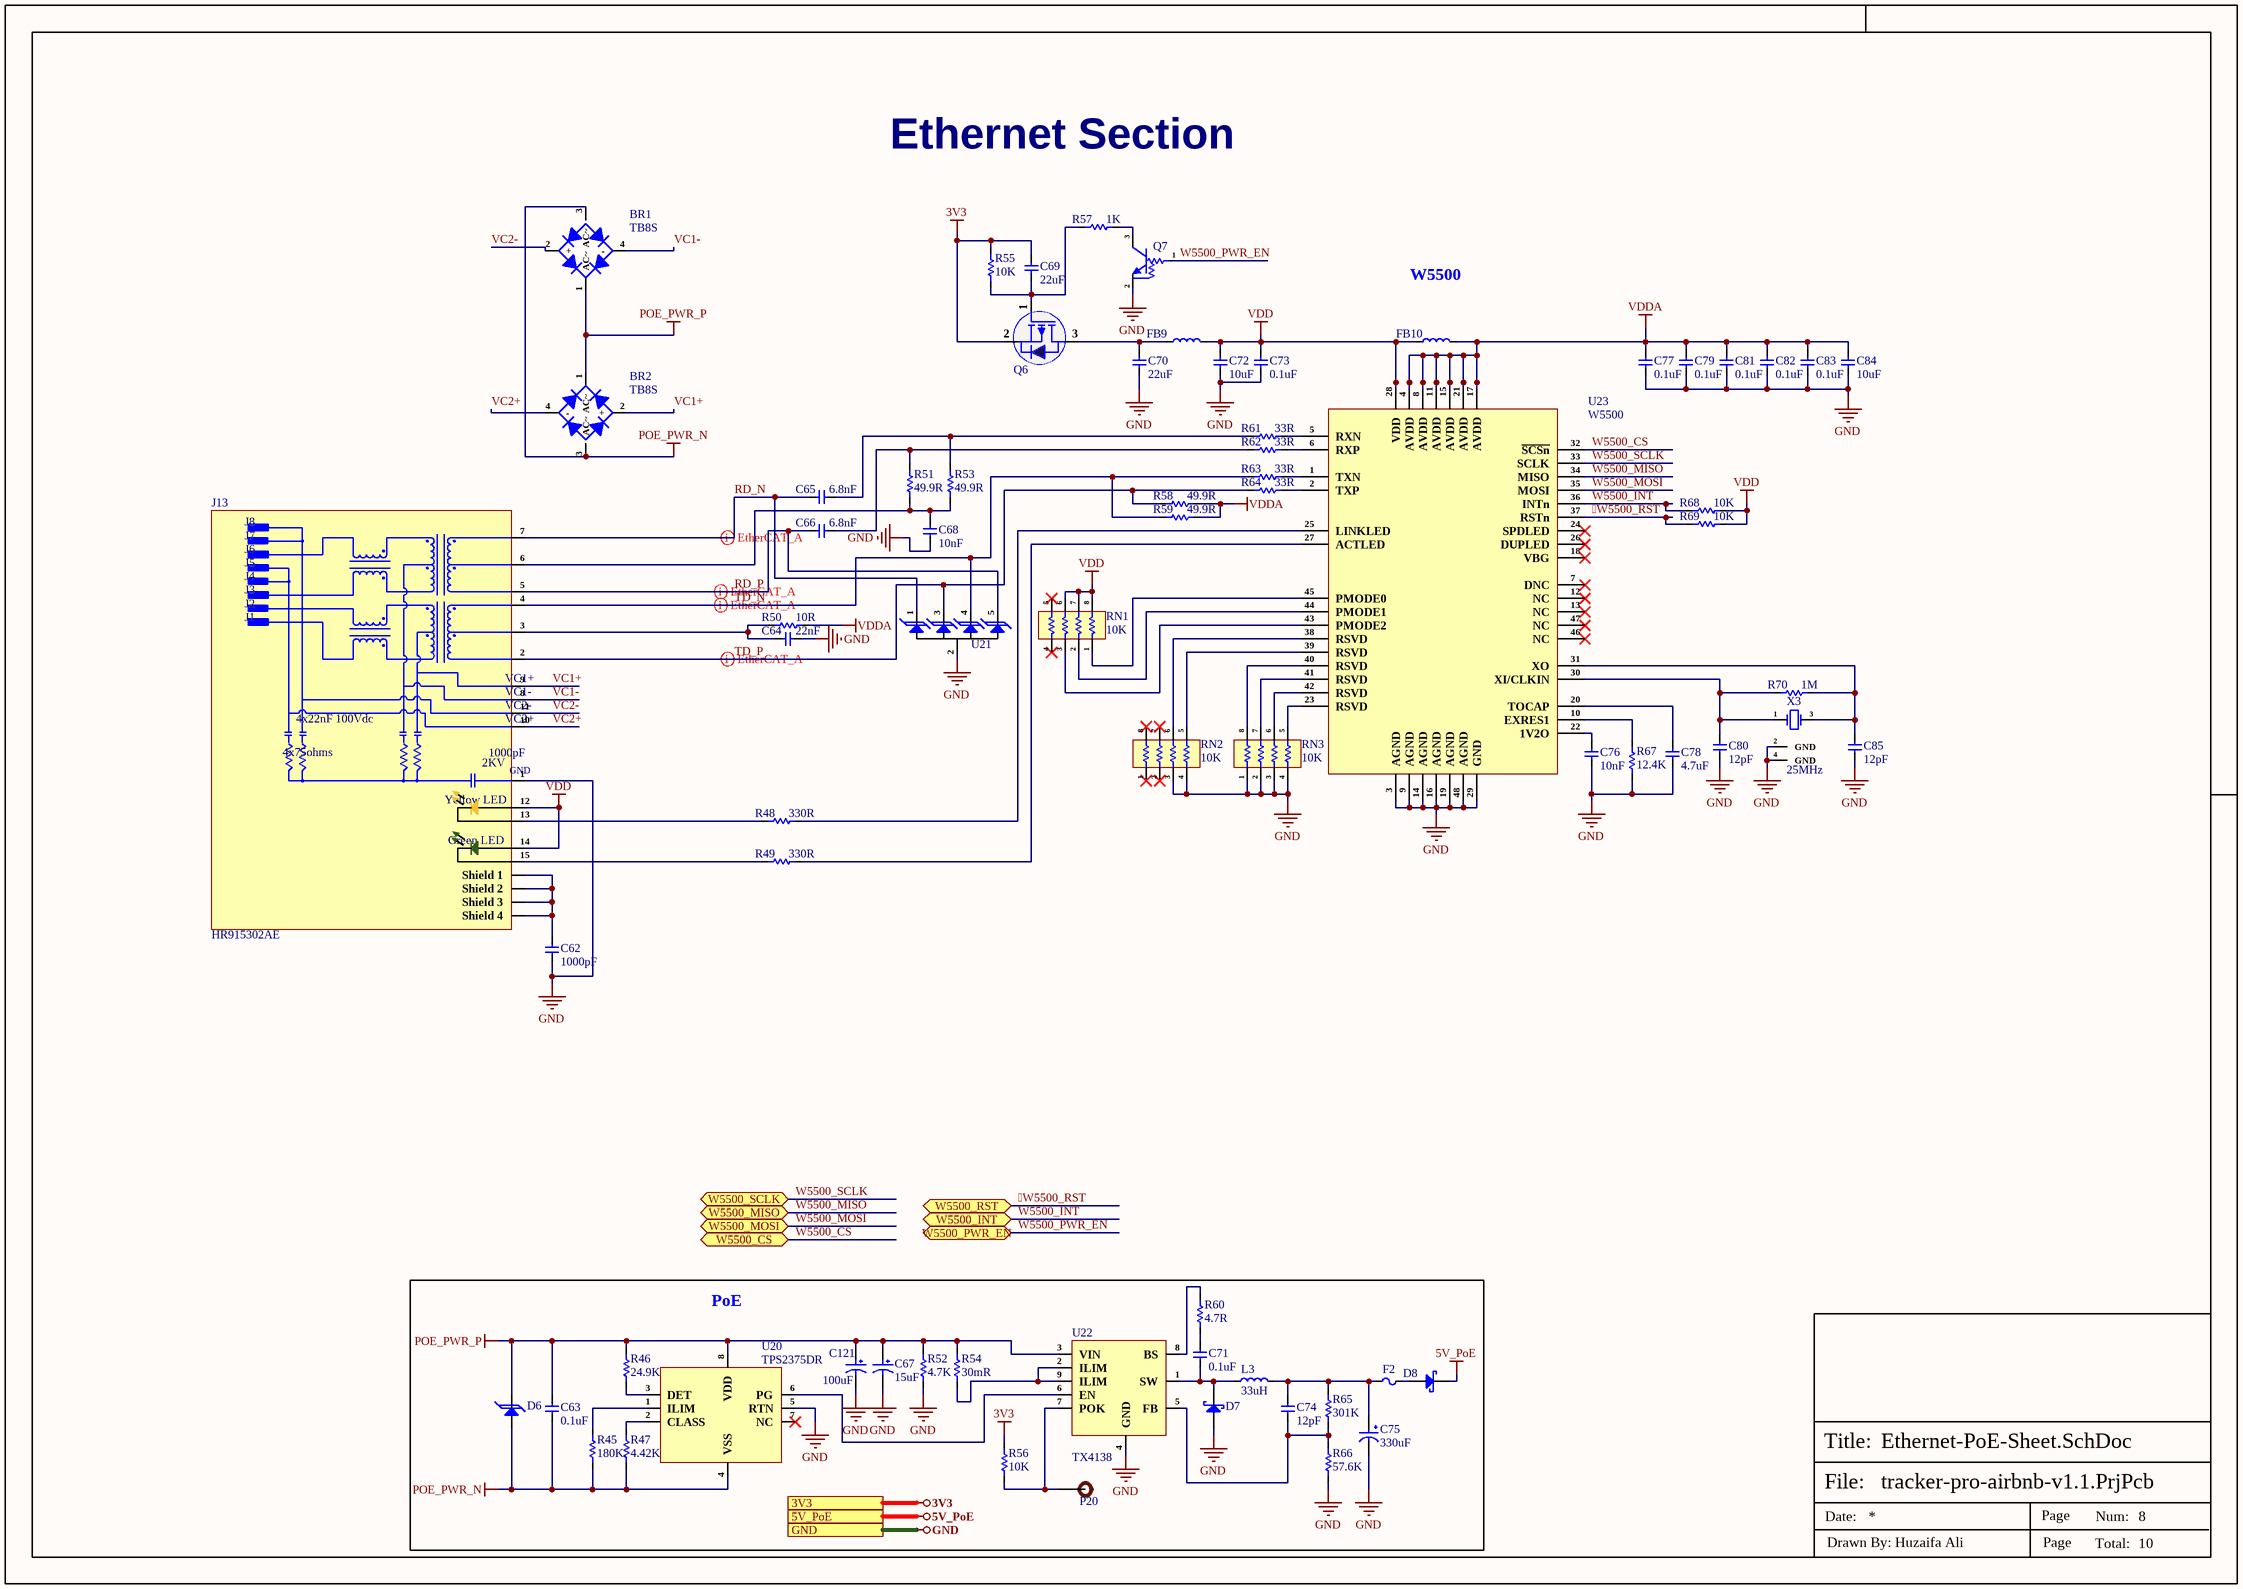
[diagram p6: Ethernet-PoE-Sheet.SchDoc]

### Parts
BR1  TB8S  [TB8S]
BR2  TB8S  [TB8S]
C62  1000pF  [Cap-1206]
C63  0.1uF  [Cap-0603]
C64  22nF  [Cap-0603]
C65  6.8nF  [Cap-0603]
C66  6.8nF  [Cap-0603]
C67  15uF  [VMMC0571J150MV]
C68  10nF  [Cap-0603]
C69  22uF  [Cap-0805]
C70  22uF  [Cap-0805]
C71  0.1uF  [Cap-0603]
C72  10uF  [Cap-0603]
C73  0.1uF  [Cap-0402]
C74  12pF  [Cap-0603]
C75  330uF  [Case-E]
C76  10nF  [Cap-0603]
C77  0.1uF  [Cap-0402]
C78  4.7uF  [Cap-0603]
C79  0.1uF  [Cap-0402]
C80  12pF  [Cap-0603]
C81  0.1uF  [Cap-0402]
C82  0.1uF  [Cap-0402]
C83  0.1uF  [Cap-0402]
C84  10uF  [Cap-0603]
C85  12pF  [Cap-0603]
C121  100uF  [VKMD1451K101MV]
D6  SMAJ58A  [SMA]  (value not drawn)
D7  SS510B  [SMB_]  (value not drawn)
D8  PMEG4030ER  [SOD-123FL]  (value not drawn)
F2  BSMD0805L-200  [Fuse-0805]  (value not drawn)
FB9  CBM201209U601T  [Ind-0805]  (value not drawn)
FB10  CBM201209U601T  [Ind-0805]  (value not drawn)
J13  HR915302AE  [HR915302AE]
L3  33uH  [CYH127-33UH]
P20  TEST POINT  [Test-point]  (value not drawn)
Q6  WPM2015-3/TR  [Sot-23]  (value not drawn)
Q7  LMUN2211LT1G  [SOT-23]  (value not drawn)
R45  180K  [Res-0603]
R46  24.9K  [Res-0603]
R47  4.42K  [Res-0603]
R48  330R  [Res-0603]
R49  330R  [Res-0603]
R50  10R  [Res-0603]
R51  49.9R  [Res-0603]
R52  4.7K  [Res-0603]
R53  49.9R  [Res-0603]
R54  30mR  [RES-0805]
R55  10K  [Res-0402]
R56  10K  [Res-0402]
R57  1K  [Res-0603]
R58  49.9R  [Res-0603]
R59  49.9R  [Res-0603]
R60  4.7R  [Res-0603]
R61  33R  [Res-0603]
R62  33R  [Res-0603]
R63  33R  [Res-0603]
R64  33R  [Res-0603]
R65  301K  [Res-0603]
R66  57.6K  [Res-0603]
R67  12.4K  [Res-0603]
R68  10K  [Res-0402]
R69  10K  [Res-0402]
R70  1M  [Res-0603]
RN1  10K  [YC164-FR-0710KL]
RN2  10K  [YC164-FR-0710KL]
RN3  10K  [YC164-FR-0710KL]
U20  TPS2375DR  [SOIC-8]
U21  SP0504BAHTG  [SOT-23-5]  (value not drawn)
U22  TX4138  [8-SOIC-EP]
U23  W5500  [48-LQFP (7x7)_]
X3  25MHz  [Q22FA12800090]

### Blocks framed on the sheet
PoE: C63 C67 C71 C74 C75 C121 D6-D8 F2 L3 P20 R45-R47 R52 R54 R56 R60 R65 R66 U20 U22

### Ports
3V3, 5V_PoE, GND, W5500_CS (bidir), W5500_INT (bidir), W5500_MISO (bidir), W5500_MOSI (bidir), W5500_PWR_EN (bidir), W5500_RST (bidir), W5500_SCLK (bidir)

### Nets
3V3: C69.2 Q6.2(S) R55.1 R56.2 ; port 3V3
5V_PoE: D8.1(K) ; port 5V_PoE
GND: C62.1 C64.2 C67.2 C68.1 C70.1 C72.1 C73.1 C75.2 C76.1 C77.1 C78.1 C79.1 C80.1 C81.1 C82.1 C83.1 C84.1 C85.1 C121.2 D7.1(A) J13.1(P1) Q7.2(E) R52.1 R66.1 R67.1 RN2.3 RN2.4 RN3.1 RN3.2 RN3.3 RN3.4 U20.5(RTN) U21.2(A) U22.4(GND) U23.3(AGND) U23.9(AGND) U23.14(AGND) U23.16(AGND) U23.19(AGND) U23.29(GND) U23.48(AGND) X3.2(GND) X3.4(GND) ; port GND
POE_PWR_N: BR1.3(AC~) BR2.3(AC~) C63.1 D6.2(K) R45.1 R47.1 U20.4(VSS)
POE_PWR_P: BR1.1(AC~) BR2.1(AC~) C63.2 C67.1 C121.1 D6.1(K) R46.2 R52.2 R54.2 U20.8(VDD) U22.3(VIN)
VDD: C72.2 C73.2 FB9.2 FB10.1 J13.12(ANODE) J13.14(ANODE) R68.1 R69.1 RN1.6 RN1.7 RN1.8 U23.28(VDD)
VDDA: C77.2 C79.2 C81.2 C82.2 C83.2 C84.2 FB10.2 R50.2 R58.2 R59.2 U23.4(AVDD) U23.8(AVDD) U23.11(AVDD) U23.15(AVDD) U23.17(AVDD) U23.21(AVDD)
W5500_RST: R69.2 U23.37(RSTn) ; port W5500_RST
RD_N: C65.1 J13.7(P7) U21.1(K)
RD_P: C66.1 J13.5(P5) U21.5(K)
TD_N: J13.4(P4) R59.1 R63.1 U21.4(K)
TD_P: J13.2(P2) R58.1 R64.1 U21.3(K)
VC1+: BR2.2(+) J13.9(VC1+)
VC1-: BR1.4(-) J13.8(VC1-)
VC2+: BR2.4(-) J13.10(VC2+)
VC2-: BR1.2(+) J13.11(VC2-)
W5500_CS: U23.32(~{SCSn}) ; port W5500_CS  [project net SPI2_CS_IO5]
W5500_INT: R68.2 U23.36(INTn) ; port W5500_INT  [project net GPIO12]
W5500_MISO: U23.34(MISO) ; port W5500_MISO  [project net SPI2_MISO_IO1]
W5500_MOSI: U23.35(MOSI) ; port W5500_MOSI  [project net SPI2_MOSI_IO2]
W5500_PWR_EN: Q7.1(B) ; port W5500_PWR_EN  [project net GPIO13]
W5500_SCLK: U23.33(SCLK) ; port W5500_SCLK  [project net SPI2_SCK_IO4]
NetC62_2: C62.2 J13.SH1(Shield_1) J13.SH2(Shield_2) J13.SH3(Shield_3) J13.SH4(Shield_4)
NetC64_1: C64.1 J13.3(P3) R50.1
NetC65_2: C65.2 R53.2 R61.1
NetC66_2: C66.2 R51.2 R62.1
NetC68_2: C68.2 J13.6(P6) R51.1 R53.1
NetC69_1: C69.1 Q6.1(G) R55.2 R57.1
NetC70_2: C70.2 FB9.1 Q6.3(D)
NetC71_1: C71.1 D7.2(K) L3.1 U22.1(SW)
NetC71_2: C71.2 R60.1
NetC74_1: C74.1 R65.1 R66.2 U22.5(FB)
NetC74_2: C74.2 C75.1 F2.1 L3.2 R65.2
NetC76_2: C76.2 U23.22(1V2O)
NetC78_2: C78.2 U23.20(TOCAP)
NetC80_2: C80.2 R70.1 U23.30(XI/CLKIN) X3.1(OSC1)
NetC85_2: C85.2 R70.2 U23.31(XO) X3.3(OSC2)
NetD8_2: D8.2(A) F2.2
NetJ13_13: J13.13(CATHODE) R48.1
NetJ13_15: J13.15(CATHODE) R49.1
NetP20_1: P20.1 R56.1 U22.7(POK)
NetQ7_3: Q7.3(C) R57.2
NetR45_2: R45.2 U20.1(ILIM)
NetR46_1: R46.1 U20.3(DET)
NetR47_2: R47.2 U20.2(CLASS)
NetR48_2: R48.2 U23.25(LINKLED)
NetR49_2: R49.2 U23.27(ACTLED)
NetR54_1: R54.1 U22.2(ILIM) U22.9(ILIM)
NetR60_2: R60.2 U22.8(BS)
NetR61_2: R61.2 U23.5(RXN)
NetR62_2: R62.2 U23.6(RXP)
NetR63_2: R63.2 U23.1(TXN)
NetR64_2: R64.2 U23.2(TXP)
NetR67_2: R67.2 U23.10(EXRES1)
NetRN1_1: RN1.1 U23.45(PMODE0)
NetRN1_2: RN1.2 U23.44(PMODE1)
NetRN1_3: RN1.3 U23.43(PMODE2)
NetRN2_5: RN2.5 U23.39(RSVD)
NetRN2_6: RN2.6 U23.38(RSVD)
NetRN3_5: RN3.5 U23.23(RSVD)
NetRN3_6: RN3.6 U23.42(RSVD)
NetRN3_7: RN3.7 U23.41(RSVD)
NetRN3_8: RN3.8 U23.40(RSVD)
NetU20_6: U20.6(PG) U22.6(EN)

Not connected (* = marked no-connect by the designer): RN1 4* 5*; RN2 1* 2* 7* 8*; U20 7(NC)*; U23 7(DNC)* 12(NC)* 13(NC)* 18(VBG)* 24(SPDLED)* 26(DUPLED)* 46(NC)* 47(NC)*

### Layout directives
differential pair; differential pair class Ethernet_Lines; net class Ethernet; rule Matched Net Lengths [Tolerance = 20mil]; rule Impedance Constraint [Min = 97.00    Max = 105.0    ]: RD_N, RD_P, TD_N, TD_P

### Notes on the sheet
- Ethernet Section
- W5500
- File:
- Title:
- Date:
- Page
- Num:
- Total:
- Drawn By: Huzaifa Ali
- (in symbol HR915302AE) J8; J7; J6; J5; J4; J3; J2; J1; 4x22nF 100Vdc; 4x75ohms; 1000pF; 2KV; GND; Yellow LED; Green LED